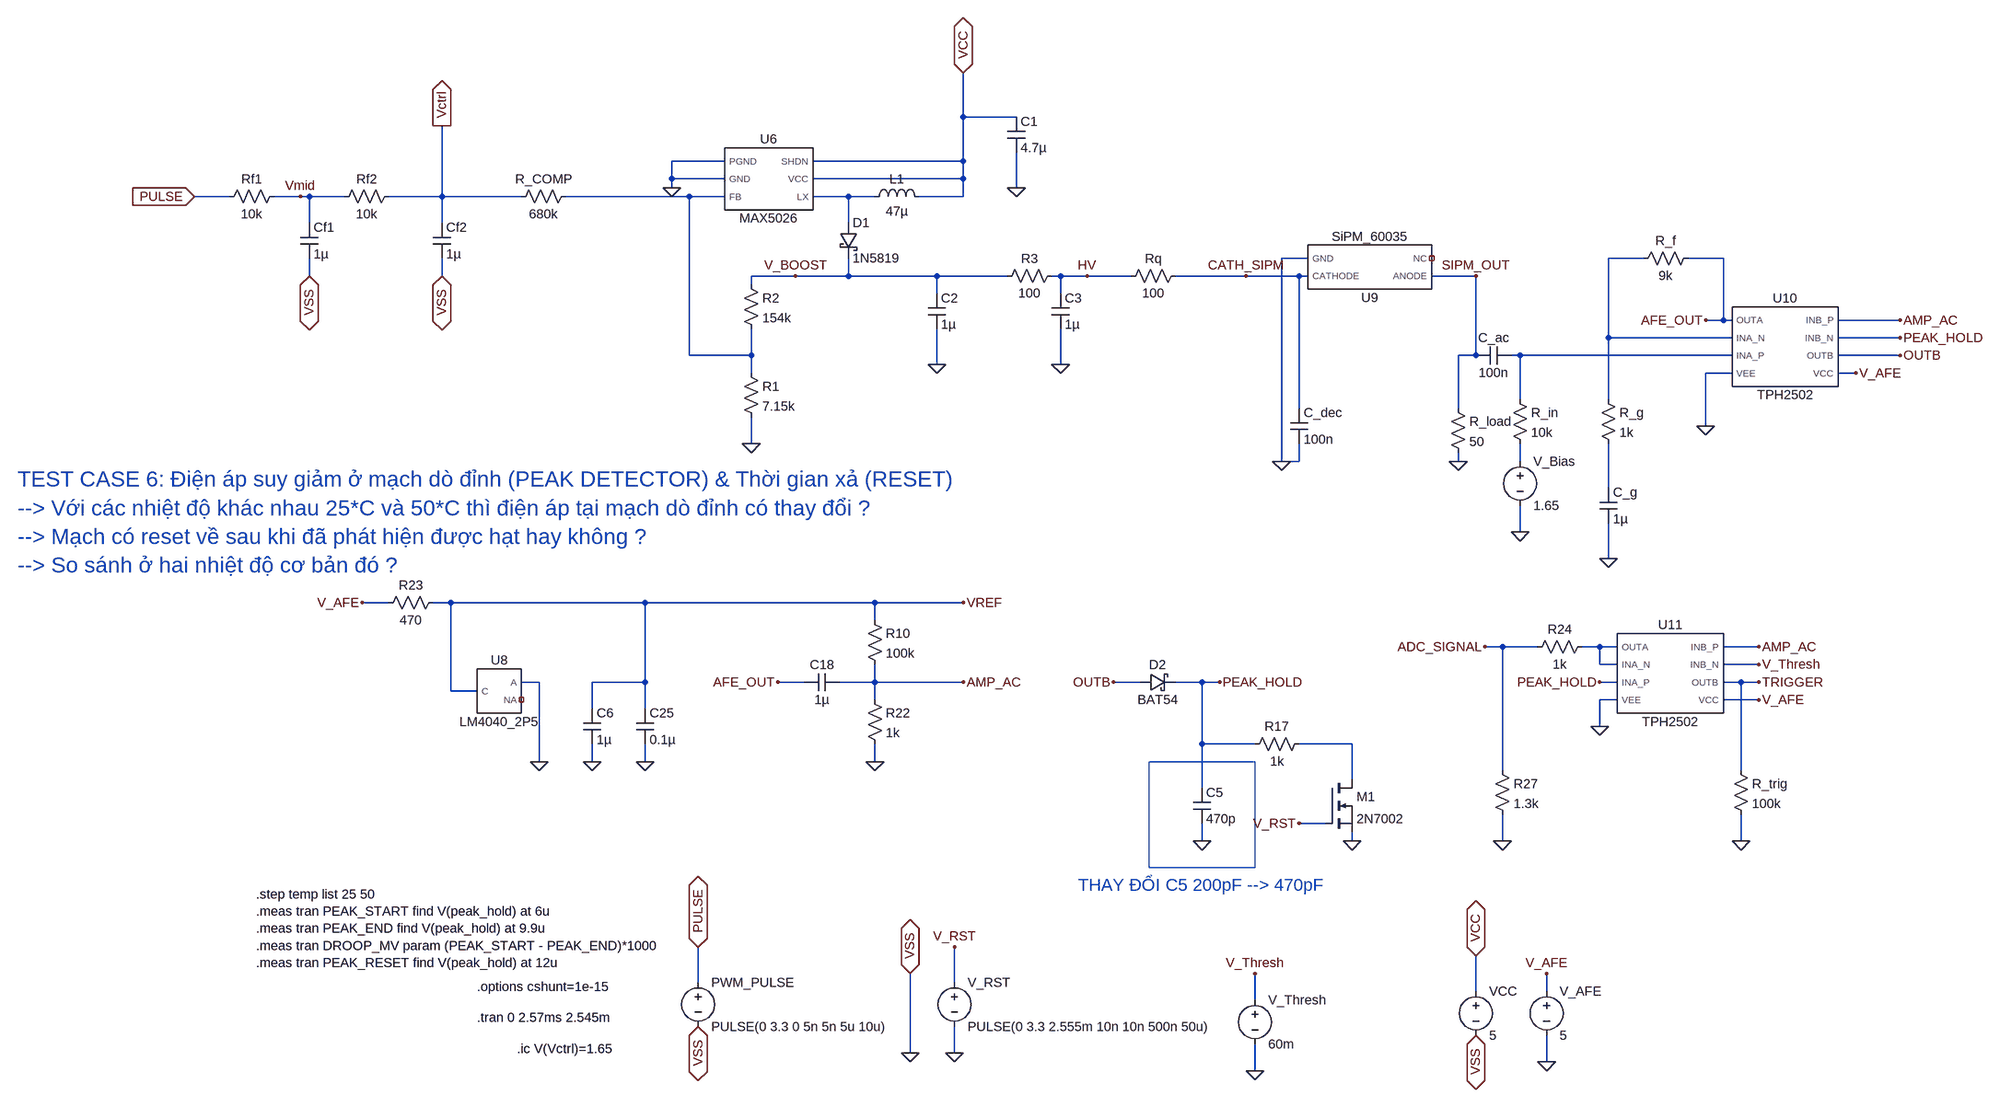
[diagram p0: schematic TEST_CASE6_PeakDetectorDrop.asc]
TEST_CASE6_PeakDetectorDrop.asc, the LTspice schematic file:
Version 4.1
SHEET 1 3112 2152
WIRE 1056 96 1056 16
WIRE 1152 96 1056 96
WIRE 624 176 528 176
WIRE 1056 176 1056 96
WIRE 1056 176 784 176
WIRE 528 208 528 176
WIRE 624 208 528 208
WIRE 1056 208 1056 176
WIRE 1056 208 784 208
WIRE 528 224 528 208
WIRE 1152 224 1152 160
WIRE -272 240 -336 240
WIRE -144 240 -192 240
WIRE -128 240 -144 240
WIRE -64 240 -128 240
WIRE 112 240 112 112
WIRE 112 240 16 240
WIRE 256 240 112 240
WIRE 560 240 336 240
WIRE 624 240 560 240
WIRE 848 240 784 240
WIRE 896 240 848 240
WIRE 1056 240 1056 208
WIRE 1056 240 976 240
WIRE -128 288 -128 240
WIRE 112 288 112 240
WIRE 848 288 848 240
WIRE 1680 352 1632 352
WIRE 2288 352 2224 352
WIRE 2432 352 2368 352
WIRE -128 384 -128 352
WIRE 112 384 112 352
WIRE 752 384 672 384
WIRE 848 384 848 352
WIRE 848 384 752 384
WIRE 1008 384 848 384
WIRE 1136 384 1008 384
WIRE 1232 384 1216 384
WIRE 1280 384 1232 384
WIRE 1360 384 1280 384
WIRE 1568 384 1440 384
WIRE 1664 384 1568 384
WIRE 1680 384 1664 384
WIRE 1984 384 1904 384
WIRE 672 400 672 384
WIRE 1008 416 1008 384
WIRE 1232 416 1232 384
WIRE 2432 464 2432 352
WIRE 2432 464 2400 464
WIRE 2448 464 2432 464
WIRE 2752 464 2640 464
WIRE 2224 496 2224 352
WIRE 2448 496 2224 496
WIRE 2752 496 2640 496
WIRE 560 528 560 240
WIRE 672 528 672 480
WIRE 672 528 560 528
WIRE 1984 528 1984 384
WIRE 1984 528 1952 528
WIRE 2064 528 2048 528
WIRE 2448 528 2064 528
WIRE 2752 528 2640 528
WIRE 1008 544 1008 480
WIRE 1232 544 1232 480
WIRE 672 560 672 528
WIRE 2448 560 2400 560
WIRE 2672 560 2640 560
WIRE 2064 608 2064 528
WIRE 2224 608 2224 496
WIRE 1664 624 1664 384
WIRE 1952 624 1952 528
WIRE 2400 656 2400 560
WIRE 672 688 672 640
WIRE 1632 720 1632 352
WIRE 1664 720 1664 688
WIRE 1664 720 1632 720
WIRE 1952 720 1952 704
WIRE 2064 720 2064 688
WIRE 2224 768 2224 688
WIRE 2064 848 2064 800
WIRE 2224 896 2224 832
WIRE 16 976 -32 976
WIRE 128 976 96 976
WIRE 480 976 128 976
WIRE 896 976 480 976
WIRE 1056 976 896 976
WIRE 896 1008 896 976
WIRE 2032 1056 2000 1056
WIRE 2096 1056 2032 1056
WIRE 2208 1056 2176 1056
WIRE 2240 1056 2208 1056
WIRE 2496 1056 2432 1056
WIRE 2208 1088 2208 1056
WIRE 2240 1088 2208 1088
WIRE 2496 1088 2432 1088
WIRE 288 1120 256 1120
WIRE 480 1120 480 976
WIRE 480 1120 384 1120
WIRE 768 1120 720 1120
WIRE 896 1120 896 1088
WIRE 896 1120 832 1120
WIRE 1056 1120 896 1120
WIRE 1376 1120 1328 1120
WIRE 1488 1120 1440 1120
WIRE 1520 1120 1488 1120
WIRE 2240 1120 2208 1120
WIRE 2464 1120 2432 1120
WIRE 2496 1120 2464 1120
WIRE 128 1136 128 976
WIRE 176 1136 128 1136
WIRE 896 1152 896 1120
WIRE 2240 1152 2208 1152
WIRE 2496 1152 2432 1152
WIRE 384 1168 384 1120
WIRE 480 1168 480 1120
WIRE 2208 1200 2208 1152
WIRE 1488 1232 1488 1120
WIRE 1584 1232 1488 1232
WIRE 1760 1232 1664 1232
WIRE 288 1264 288 1120
WIRE 384 1264 384 1232
WIRE 480 1264 480 1232
WIRE 896 1264 896 1232
WIRE 2032 1280 2032 1056
WIRE 2464 1280 2464 1120
WIRE 1760 1296 1760 1232
WIRE 1488 1312 1488 1232
WIRE 1712 1376 1664 1376
WIRE 1488 1408 1488 1376
WIRE 1760 1408 1760 1392
WIRE 2032 1408 2032 1360
WIRE 2464 1408 2464 1360
WIRE 576 1664 576 1600
WIRE 1040 1664 1040 1600
WIRE 1984 1680 1984 1616
WIRE 2112 1680 2112 1648
WIRE 1584 1696 1584 1648
WIRE 960 1792 960 1648
WIRE 1040 1792 1040 1744
WIRE 2112 1808 2112 1760
WIRE 1584 1824 1584 1776
FLAG 960 1792 0
FLAG 960 1648 VSS
IOPIN 960 1648 BiDir
FLAG 576 1744 VSS
IOPIN 576 1744 BiDir
FLAG 576 1600 PULSE
IOPIN 576 1600 BiDir
FLAG 112 384 VSS
IOPIN 112 384 BiDir
FLAG -128 384 VSS
IOPIN -128 384 BiDir
FLAG -336 240 PULSE
IOPIN -336 240 In
FLAG 112 112 Vctrl
IOPIN 112 112 Out
FLAG 528 224 0
FLAG 1984 1760 VSS
IOPIN 1984 1760 BiDir
FLAG 1984 1616 VCC
IOPIN 1984 1616 BiDir
FLAG 1152 224 0
FLAG 672 688 0
FLAG 752 384 V_BOOST
FLAG 1008 544 0
FLAG 1280 384 HV
FLAG 1232 544 0
FLAG 1984 384 SIPM_OUT
FLAG 1632 720 0
FLAG 1568 384 CATH_SIPM
FLAG 2064 848 0
FLAG 2112 1808 0
FLAG 2400 656 0
FLAG 2112 1648 V_AFE
FLAG 2400 464 AFE_OUT
FLAG 2224 896 0
FLAG 1952 720 0
FLAG 1056 976 VREF
FLAG 384 1264 0
FLAG 480 1264 0
FLAG 288 1264 0
FLAG 896 1264 0
FLAG 720 1120 AFE_OUT
FLAG 1056 1120 AMP_AC
FLAG 2752 528 OUTB
FLAG 2752 496 PEAK_HOLD
FLAG 2752 464 AMP_AC
FLAG 1328 1120 OUTB
FLAG 1520 1120 PEAK_HOLD
FLAG 1488 1408 0
FLAG 1760 1408 0
FLAG 1040 1792 0
FLAG 1040 1600 V_RST
FLAG 1664 1376 V_RST
FLAG 2208 1120 PEAK_HOLD
FLAG 2000 1056 ADC_SIGNAL
FLAG 2032 1408 0
FLAG 2496 1056 AMP_AC
FLAG 1584 1648 V_Thresh
FLAG 1584 1824 0
FLAG 2496 1088 V_Thresh
FLAG 2496 1120 TRIGGER
FLAG 2464 1408 0
FLAG 2208 1200 0
FLAG -144 240 Vmid
FLAG 1056 16 VCC
IOPIN 1056 16 BiDir
FLAG 2672 560 V_AFE
FLAG 2496 1152 V_AFE
FLAG -32 976 V_AFE
SYMBOL voltage 576 1648 R0
WINDOW 123 0 0 Left 0
WINDOW 39 0 0 Left 0
SYMATTR InstName PWM_PULSE
SYMATTR Value PULSE(0 3.3 0 5n 5n 5u 10u)
SYMBOL res -288 256 R270
WINDOW 0 32 56 VTop 2
WINDOW 3 0 56 VBottom 2
SYMATTR InstName Rf1
SYMATTR Value 10k
SYMBOL res -80 256 R270
WINDOW 0 32 56 VTop 2
WINDOW 3 0 56 VBottom 2
SYMATTR InstName Rf2
SYMATTR Value 10k
SYMBOL cap -144 288 R0
SYMATTR InstName Cf1
SYMATTR Value 1µ
SYMBOL cap 96 288 R0
SYMATTR InstName Cf2
SYMATTR Value 1µ
SYMBOL res 240 256 R270
WINDOW 0 32 56 VTop 2
WINDOW 3 0 56 VBottom 2
SYMATTR InstName R_COMP
SYMATTR Value 680k
SYMBOL ind 880 256 R270
WINDOW 0 32 56 VTop 2
WINDOW 3 5 56 VBottom 2
SYMATTR InstName L1
SYMATTR Value 47µ
SYMATTR SpiceLine Ipk=300m Cpar=5p
SYMBOL voltage 1984 1664 R0
WINDOW 123 0 0 Left 0
WINDOW 39 0 0 Left 0
SYMATTR InstName VCC
SYMATTR Value 5
SYMBOL cap 1136 96 R0
SYMATTR InstName C1
SYMATTR Value 4.7µ
SYMATTR SpiceLine Rser=20m
SYMBOL schottky 832 288 R0
SYMATTR InstName D1
SYMATTR Value 1N5819
SYMATTR Description Diode
SYMATTR Type diode
SYMBOL res 656 544 R0
SYMATTR InstName R1
SYMATTR Value 7.15k
SYMBOL res 656 384 R0
SYMATTR InstName R2
SYMATTR Value 154k
SYMBOL cap 992 416 R0
SYMATTR InstName C2
SYMATTR Value 1µ
SYMATTR SpiceLine Rser=20m
SYMBOL res 1232 368 R90
WINDOW 0 0 56 VBottom 2
WINDOW 3 32 56 VTop 2
SYMATTR InstName R3
SYMATTR Value 100
SYMBOL cap 1216 416 R0
SYMATTR InstName C3
SYMATTR Value 1µ
SYMATTR SpiceLine Rser=20m
SYMBOL res 1456 368 R90
WINDOW 0 0 56 VBottom 2
WINDOW 3 32 56 VTop 2
SYMATTR InstName Rq
SYMATTR Value 100
SYMBOL cap 2048 512 R90
WINDOW 0 0 32 VBottom 2
WINDOW 3 32 32 VTop 2
SYMATTR InstName C_ac
SYMATTR Value 100n
SYMBOL voltage 2112 1664 R0
SYMATTR InstName V_AFE
SYMATTR Value 5
SYMBOL voltage 2064 704 R0
SYMATTR InstName V_Bias
SYMATTR Value 1.65
SYMBOL res 2048 592 R0
SYMATTR InstName R_in
SYMATTR Value 10k
SYMBOL res 2384 336 R90
WINDOW 0 0 56 VBottom 2
WINDOW 3 32 56 VTop 2
SYMATTR InstName R_f
SYMATTR Value 9k
SYMBOL res 2208 592 R0
SYMATTR InstName R_g
SYMATTR Value 1k
SYMBOL cap 2208 768 R0
SYMATTR InstName C_g
SYMATTR Value 1µ
SYMBOL cap 1648 624 R0
SYMATTR InstName C_dec
SYMATTR Value 100n
SYMBOL res 1936 608 R0
SYMATTR InstName R_load
SYMATTR Value 50
SYMBOL res 0 992 R270
WINDOW 0 32 56 VTop 2
WINDOW 3 0 56 VBottom 2
SYMATTR InstName R23
SYMATTR Value 470
SYMBOL cap 368 1168 R0
SYMATTR InstName C6
SYMATTR Value 1µ
SYMATTR SpiceLine Rser=20m
SYMBOL cap 464 1168 R0
SYMATTR InstName C25
SYMATTR Value 0.1µ
SYMATTR SpiceLine Rser=20m
SYMBOL cap 832 1104 R90
WINDOW 0 0 32 VBottom 2
WINDOW 3 32 32 VTop 2
SYMATTR InstName C18
SYMATTR Value 1µ
SYMBOL res 880 992 R0
SYMATTR InstName R10
SYMATTR Value 100k
SYMBOL res 880 1136 R0
SYMATTR InstName R22
SYMATTR Value 1k
SYMBOL schottky 1376 1136 R270
WINDOW 0 32 32 VTop 2
WINDOW 3 0 32 VBottom 2
SYMATTR InstName D2
SYMATTR Value BAT54
SYMATTR Description Diode
SYMATTR Type diode
SYMBOL cap 1472 1312 R0
SYMATTR InstName C5
SYMATTR Value 470p
SYMBOL res 1680 1216 R90
WINDOW 0 0 56 VBottom 2
WINDOW 3 32 56 VTop 2
SYMATTR InstName R17
SYMATTR Value 1k
SYMBOL voltage 1040 1648 R0
SYMATTR InstName V_RST
SYMATTR Value PULSE(0 3.3 2.555m 10n 10n 500n 50u)
SYMBOL nmos 1712 1296 R0
SYMATTR InstName M1
SYMATTR Value 2N7002
SYMBOL res 2192 1040 R90
WINDOW 0 0 56 VBottom 2
WINDOW 3 32 56 VTop 2
SYMATTR InstName R24
SYMATTR Value 1k
SYMBOL res 2016 1264 R0
SYMATTR InstName R27
SYMATTR Value 1.3k
SYMBOL voltage 1584 1680 R0
SYMATTR InstName V_Thresh
SYMATTR Value 60m
SYMBOL res 2448 1264 R0
SYMATTR InstName R_trig
SYMATTR Value 100k
SYMBOL MAX5026 704 208 R0
SYMATTR InstName U6
SYMBOL LM4040_2P5 208 1136 R0
SYMATTR InstName U8
SYMBOL SiPM_60035 1792 368 R180
SYMATTR InstName U9
SYMBOL TPH2502 2544 512 R0
SYMATTR InstName U10
SYMBOL TPH2502 2336 1104 R0
SYMATTR InstName U11
TEXT 248 1784 Left 2 !.ic V(Vctrl)=1.65
TEXT 176 1728 Left 2 !.tran 0 2.57ms 2.545m
TEXT 176 1672 Left 2 !.options cshunt=1e-15
TEXT -224 1504 Left 2 !.step temp list 25 50\n.meas tran PEAK_START find V(peak_hold) at 6u\n.meas tran PEAK_END find V(peak_hold) at 9.9u\n.meas tran DROOP_MV param (PEAK_START - PEAK_END)*1000\n.meas tran PEAK_RESET find V(peak_hold) at 12u
TEXT -656 752 Left 4 ;TEST CASE 6: Điện áp suy giảm ở mạch dò đỉnh (PEAK DETECTOR) & Thời gian xả (RESET)\n--> Với các nhiệt độ khác nhau 25*C và 50*C thì điện áp tại mạch dò đỉnh có thay đổi ?\n--> Mạch có reset về sau khi đã phát hiện được hạt hay không ?\n--> So sánh ở hai nhiệt độ cơ bản đó ?
TEXT 1264 1488 Left 3 ;THAY ĐỔI C5 200pF --> 470pF
RECTANGLE Normal 1584 1456 1392 1264

The netlist it stands for:
* TEST_CASE6_PeakDetectorDrop.asc
V§PWM_PULSE PULSE 0 PULSE(0 3.3 0 5n 5n 5u 10u)
Rf1 PULSE Vmid 10k
Rf2 Vmid Vctrl 10k
Cf1 Vmid 0 1µ
Cf2 Vctrl 0 1µ
R_COMP Vctrl N001 680k
L1 N002 VCC 47µ Ipk=300m Cpar=5p
VCC VCC 0 5
C1 VCC 0 4.7µ Rser=20m
D1 N002 V_BOOST 1N5819
R1 N001 0 7.15k
R2 V_BOOST N001 154k
C2 V_BOOST 0 1µ Rser=20m
R3 HV V_BOOST 100
C3 HV 0 1µ Rser=20m
Rq CATH_SIPM HV 100
C_ac N004 SIPM_OUT 100n
V_AFE V_AFE 0 5
V_Bias N005 0 1.65
R_in N004 N005 10k
R_f AFE_OUT N003 9k
R_g N003 N006 1k
C_g N006 0 1µ
C_dec CATH_SIPM 0 100n
R_load SIPM_OUT 0 50
R23 V_AFE VREF 470
C6 VREF 0 1µ Rser=20m
C25 VREF 0 0.1µ Rser=20m
C18 AMP_AC AFE_OUT 1µ
R10 VREF AMP_AC 100k
R22 AMP_AC 0 1k
D2 OUTB PEAK_HOLD BAT54
C5 PEAK_HOLD 0 470p
R17 N008 PEAK_HOLD 1k
V_RST V_RST 0 PULSE(0 3.3 2.555m 10n 10n 500n 50u)
M1 N008 V_RST 0 0 2N7002
R24 N007 ADC_SIGNAL 1k
R27 ADC_SIGNAL 0 1.3k
V_Thresh V_Thresh 0 60m
R_trig TRIGGER 0 100k
X§U6 0 0 N001 VCC VCC N002 MAX5026  ; pins PGND GND FB SHDN VCC LX
X§U8 VREF 0 NC_01 LM4040_2P5  ; pins C A NA
X§U9 SIPM_OUT NC_02 CATH_SIPM 0 SiPM_60035  ; pins ANODE NC CATHODE GND
X§U10 AFE_OUT N003 N004 0 AMP_AC PEAK_HOLD OUTB V_AFE TPH2502  ; pins OUTA INA_N INA_P VEE INB_P INB_N OUTB VCC
X§U11 N007 N007 PEAK_HOLD 0 AMP_AC V_Thresh TRIGGER V_AFE TPH2502  ; pins OUTA INA_N INA_P VEE INB_P INB_N OUTB VCC
.model D D
.lib standard.dio
.model NMOS NMOS
.model PMOS PMOS
.lib standard.mos
.ic V(Vctrl)=1.65
.tran 0 2.57ms 2.545m
.options cshunt=1e-15
.step temp list 25 50
.meas tran PEAK_START find V(peak_hold) at 6u
.meas tran PEAK_END find V(peak_hold) at 9.9u
.meas tran DROOP_MV param (PEAK_START - PEAK_END)*1000
.meas tran PEAK_RESET find V(peak_hold) at 12u
* TEST CASE 6: Điện áp suy giảm ở mạch dò đỉnh (PEAK DETECTOR) & Thời gian xả (RESET)
* --> Với các nhiệt độ khác nhau 25*C và 50*C thì điện áp tại mạch dò đỉnh có thay đổi ?
* --> Mạch có reset về sau khi đã phát hiện được hạt hay không ?
* --> So sánh ở hai nhiệt độ cơ bản đó ?
* THAY ĐỔI C5 200pF --> 470pF
.lib C:\Users\Truong_Tuan_Vi\CosmicChip\OUR PROJECT\Architectus\Simulation\MAX5026.sub
.lib C:\Users\Truong_Tuan_Vi\CosmicChip\OUR PROJECT\Architectus\Simulation\LM4040_2P5.sub
.lib C:\Users\Truong_Tuan_Vi\CosmicChip\OUR PROJECT\Architectus\Simulation\SiPM_60035.sub
.lib C:\Users\Truong_Tuan_Vi\CosmicChip\OUR PROJECT\Architectus\Simulation\TPH2502.sub
.backanno
.end